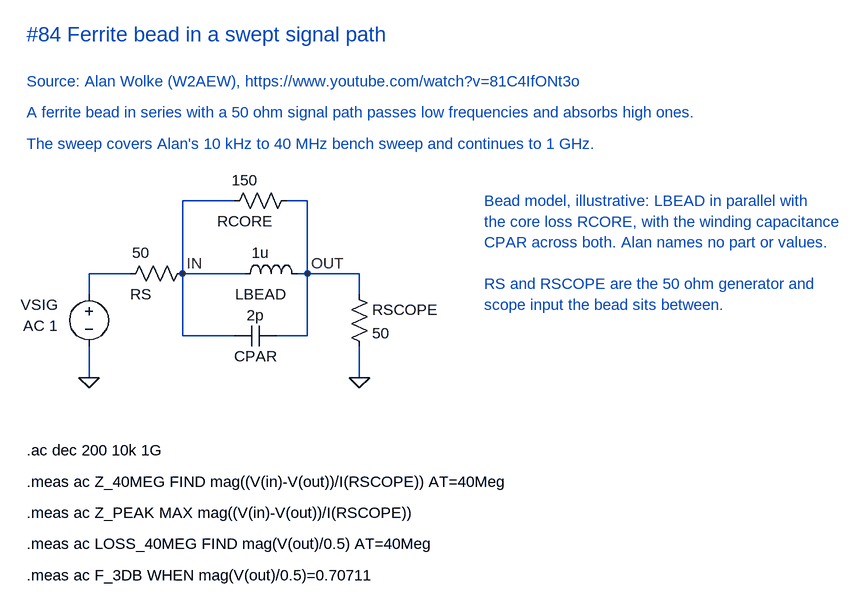
[diagram p0: schematic Ferrite bead frequency sweep.asc]
Ferrite bead frequency sweep.asc, the LTspice schematic file:
Version 4.1
SHEET 1 1100 800
WIRE 64 0 64 32
WIRE 128 0 64 0
WIRE 304 0 208 0
WIRE 400 0 384 0
WIRE 480 0 400 0
WIRE 64 112 64 160
WIRE 208 -112 208 0
WIRE 288 -112 208 -112
WIRE 400 -112 368 -112
WIRE 400 0 400 -112
WIRE 208 96 208 0
WIRE 288 96 208 96
WIRE 400 96 352 96
WIRE 400 96 400 0
WIRE 480 32 480 0
WIRE 480 160 480 112
FLAG 64 160 0
FLAG 480 160 0
FLAG 208 0 IN
FLAG 400 0 OUT
SYMBOL voltage 64 16 R0
WINDOW 123 0 0 Left 0
WINDOW 39 0 0 Left 0
WINDOW 0 -48 32 Right 2
WINDOW 3 -48 64 Right 2
SYMATTR InstName VSIG
SYMATTR Value AC 1
SYMBOL res 112 16 R270
WINDOW 0 0 32 VBottom 2
WINDOW 3 32 32 VTop 2
SYMATTR InstName RS
SYMATTR Value 50
SYMBOL ind 288 16 R270
WINDOW 0 0 40 VBottom 2
WINDOW 3 32 40 VTop 2
SYMATTR InstName LBEAD
SYMATTR Value 1u
SYMBOL res 272 -96 R270
WINDOW 0 0 32 VBottom 2
WINDOW 3 32 32 VTop 2
SYMATTR InstName RCORE
SYMATTR Value 150
SYMBOL cap 288 112 R270
WINDOW 0 0 32 VBottom 2
WINDOW 3 32 32 VTop 2
SYMATTR InstName CPAR
SYMATTR Value 2p
SYMBOL res 464 16 R0
SYMATTR InstName RSCOPE
SYMATTR Value 50
TEXT -32 -368 Left 3 ;#84 Ferrite bead in a swept signal path
TEXT -32 -296 Left 2 ;Source: Alan Wolke (W2AEW), https://www.youtube.com/watch?v=81C4IfONt3o
TEXT -32 -248 Left 2 ;A ferrite bead in series with a 50 ohm signal path passes low frequencies and absorbs high ones.
TEXT -32 -200 Left 2 ;The sweep covers Alan's 10 kHz to 40 MHz bench sweep and continues to 1 GHz.
TEXT 672 -112 Left 2 ;Bead model, illustrative: LBEAD in parallel with
TEXT 672 -80 Left 2 ;the core loss RCORE, with the winding capacitance
TEXT 672 -48 Left 2 ;CPAR across both. Alan names no part or values.
TEXT 672 16 Left 2 ;RS and RSCOPE are the 50 ohm generator and
TEXT 672 48 Left 2 ;scope input the bead sits between.
TEXT -32 272 Left 2 !.ac dec 200 10k 1G
TEXT -32 320 Left 2 !.meas ac Z_40MEG FIND mag((V(in)-V(out))/I(RSCOPE)) AT=40Meg
TEXT -32 368 Left 2 !.meas ac Z_PEAK MAX mag((V(in)-V(out))/I(RSCOPE))
TEXT -32 416 Left 2 !.meas ac LOSS_40MEG FIND mag(V(out)/0.5) AT=40Meg
TEXT -32 464 Left 2 !.meas ac F_3DB WHEN mag(V(out)/0.5)=0.70711

The netlist it stands for:
* Ferrite bead frequency sweep.asc
VSIG N001 0 AC 1
RS N001 IN 50
LBEAD IN OUT 1u
RCORE IN OUT 150
CPAR IN OUT 2p
RSCOPE OUT 0 50
* #84 Ferrite bead in a swept signal path
* Source: Alan Wolke (W2AEW), https://www.youtube.com/watch?v=81C4IfONt3o
* A ferrite bead in series with a 50 ohm signal path passes low frequencies and absorbs high ones.
* The sweep covers Alan's 10 kHz to 40 MHz bench sweep and continues to 1 GHz.
* Bead model, illustrative: LBEAD in parallel with
* the core loss RCORE, with the winding capacitance
* CPAR across both. Alan names no part or values.
* RS and RSCOPE are the 50 ohm generator and
* scope input the bead sits between.
.ac dec 200 10k 1G
.meas ac Z_40MEG FIND mag((V(in)-V(out))/I(RSCOPE)) AT=40Meg
.meas ac Z_PEAK MAX mag((V(in)-V(out))/I(RSCOPE))
.meas ac LOSS_40MEG FIND mag(V(out)/0.5) AT=40Meg
.meas ac F_3DB WHEN mag(V(out)/0.5)=0.70711
.backanno
.end